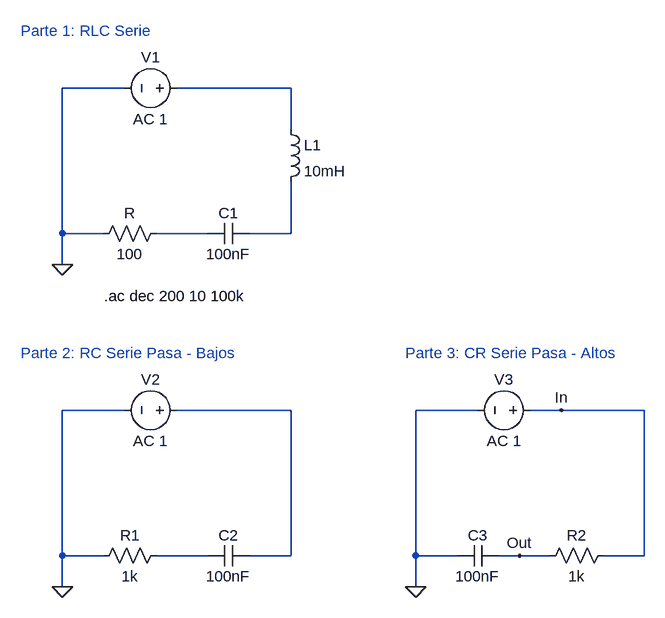
[diagram p0: schematic FiltersSimpleElectronics.asc]
FiltersSimpleElectronics.asc, the LTspice schematic file:
Version 4
SHEET 1 900 1024
WIRE 96 112 0 112
WIRE 352 112 176 112
WIRE 352 176 352 112
WIRE 0 336 0 112
WIRE 64 336 0 336
WIRE 224 336 144 336
WIRE 352 336 352 256
WIRE 352 336 288 336
WIRE 0 384 0 336
WIRE 96 608 0 608
WIRE 352 608 176 608
WIRE 640 608 544 608
WIRE 768 608 720 608
WIRE 896 608 768 608
WIRE 0 832 0 608
WIRE 64 832 0 832
WIRE 224 832 144 832
WIRE 352 832 352 608
WIRE 352 832 288 832
WIRE 544 832 544 608
WIRE 608 832 544 832
WIRE 704 832 672 832
WIRE 752 832 704 832
WIRE 896 832 896 608
WIRE 896 832 832 832
WIRE 0 880 0 832
WIRE 544 880 544 832
FLAG 0 384 0
FLAG 0 880 0
FLAG 544 880 0
FLAG 768 608 In
FLAG 704 832 Out
SYMBOL voltage 192 112 R90
WINDOW 0 -32 56 VBottom 2
WINDOW 3 32 56 VTop 2
WINDOW 123 0 0 Left 0
WINDOW 39 0 0 Left 0
SYMATTR InstName V1
SYMATTR Value AC 1
SYMBOL ind 336 160 R0
SYMATTR InstName L1
SYMATTR Value 10mH
SYMBOL cap 288 320 R90
WINDOW 0 0 32 VBottom 2
WINDOW 3 32 32 VTop 2
SYMATTR InstName C1
SYMATTR Value 100nF
SYMBOL res 160 320 R90
WINDOW 0 0 56 VBottom 2
WINDOW 3 32 56 VTop 2
SYMATTR InstName R
SYMATTR Value 100
SYMBOL voltage 192 608 R90
WINDOW 0 -32 56 VBottom 2
WINDOW 3 32 56 VTop 2
WINDOW 123 0 0 Left 0
WINDOW 39 0 0 Left 0
SYMATTR InstName V2
SYMATTR Value AC 1
SYMBOL cap 288 816 R90
WINDOW 0 0 32 VBottom 2
WINDOW 3 32 32 VTop 2
SYMATTR InstName C2
SYMATTR Value 100nF
SYMBOL res 160 816 R90
WINDOW 0 0 56 VBottom 2
WINDOW 3 32 56 VTop 2
SYMATTR InstName R1
SYMATTR Value 1k
SYMBOL voltage 736 608 R90
WINDOW 0 -32 56 VBottom 2
WINDOW 3 32 56 VTop 2
WINDOW 123 0 0 Left 0
WINDOW 39 0 0 Left 0
SYMATTR InstName V3
SYMATTR Value AC 1
SYMBOL cap 672 816 R90
WINDOW 0 0 32 VBottom 2
WINDOW 3 32 32 VTop 2
SYMATTR InstName C3
SYMATTR Value 100nF
SYMBOL res 848 816 R90
WINDOW 0 0 56 VBottom 2
WINDOW 3 32 56 VTop 2
SYMATTR InstName R2
SYMATTR Value 1k
TEXT 64 432 Left 2 !.ac dec 200 10 100k
TEXT -64 24 Left 2 ;Parte 1: RLC Serie
TEXT -64 520 Left 2 ;Parte 2: RC Serie Pasa - Bajos
TEXT 528 520 Left 2 ;Parte 3: CR Serie Pasa - Altos

The netlist it stands for:
* FiltersSimpleElectronics.asc
V1 N001 0 AC 1
L1 N001 N003 10mH
C1 N003 N002 100nF
R N002 0 100
V2 N004 0 AC 1
C2 N004 N005 100nF
R1 N005 0 1k
V3 In 0 AC 1
C3 Out 0 100nF
R2 In Out 1k
.ac dec 200 10 100k
* Parte 1: RLC Serie
* Parte 2: RC Serie Pasa - Bajos
* Parte 3: CR Serie Pasa - Altos
.backanno
.end